# Altium project macropad.PrjPcb
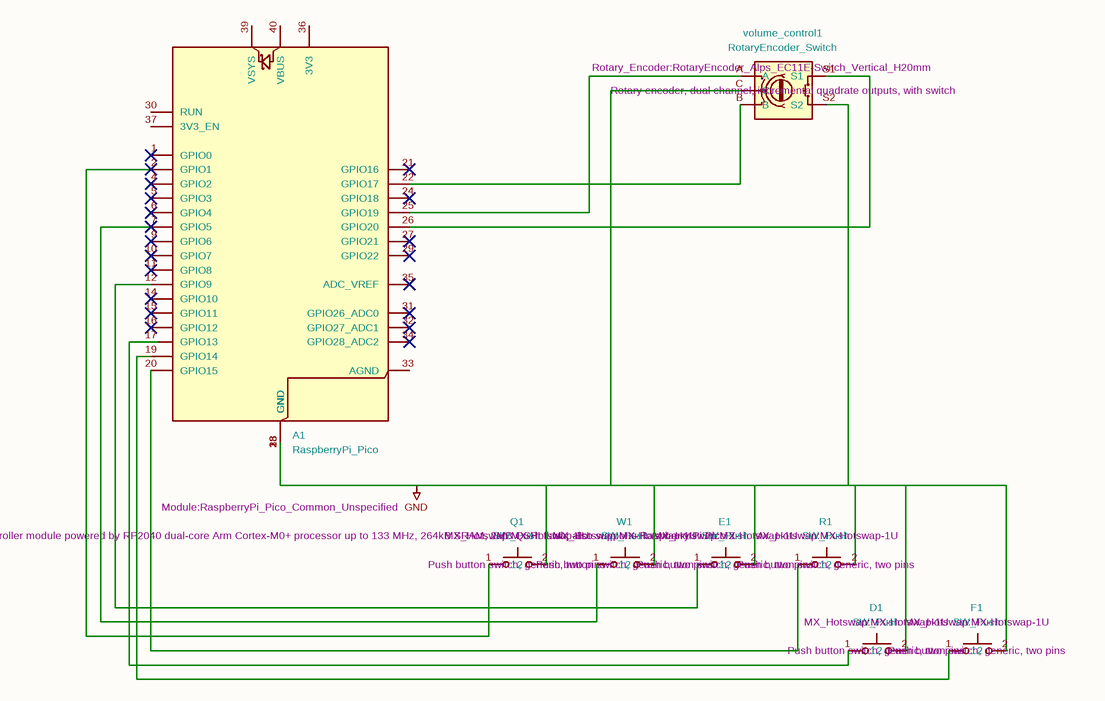
[diagram p0: macropad.SchDoc]
2 sheets, 60 parts. Net scope: global (net labels, ports and power ports of the same name join across sheets).
Board files: macropad.PcbDoc, macropad_v2.PcbDoc
Sheets:
  macropad.SchDoc
  macropad_v2.SchDoc

## Sheet macropad.SchDoc
size 297 x 209 mm

### Parts
A1  Description: Versatile and inexpensive microcontroller module powered by RP2040 dual-core Arm Cortex-M0+ processor up to 133 MHz, 264kB SRAM, 2MB QSPI flash; also supports Raspberry Pi Pico 2  Footprint: Module:RaspberryPi_Pico_Common_Unspecified  [RaspberryPi_Pico_Common_Unspecified]  (hidden comment: RaspberryPi_Pico)
D1  Description: Push button switch, generic, two pins  Footprint: MX_Hotswap:MX-Hotswap-1U  [MX-Hotswap-1U]  (hidden comment: SW_Push)
E1  Description: Push button switch, generic, two pins  Footprint: MX_Hotswap:MX-Hotswap-1U  [MX-Hotswap-1U]  (hidden comment: SW_Push)
F1  Description: Push button switch, generic, two pins  Footprint: MX_Hotswap:MX-Hotswap-1U  [MX-Hotswap-1U]  (hidden comment: SW_Push)
Q1  Description: Push button switch, generic, two pins  Footprint: MX_Hotswap:MX-Hotswap-1U  [MX-Hotswap-1U]  (hidden comment: SW_Push)
R1  Description: Push button switch, generic, two pins  Footprint: MX_Hotswap:MX-Hotswap-1U  [MX-Hotswap-1U]  (hidden comment: SW_Push)
volume_control1  Description: Rotary encoder, dual channel, incremental quadrate outputs, with switch  Footprint: Rotary_Encoder:RotaryEncoder_Alps_EC11E-Switch_Vertical_H20mm  [RotaryEncoder_Alps_EC11E-Switch_Vertical_H20mm]  (hidden comment: RotaryEncoder_Switch)
W1  Description: Push button switch, generic, two pins  Footprint: MX_Hotswap:MX-Hotswap-1U  [MX-Hotswap-1U]  (hidden comment: SW_Push)

### Nets
GND: A1.3(GND) A1.8(GND) A1.13(GND) A1.18(GND) A1.23(GND) A1.28(GND) A1.38(GND) D1.2 E1.2 F1.2 Q1.2 R1.2 volume_control1.C volume_control1.S2 W1.2
NetA1_2: A1.2(GPIO1) Q1.1
NetA1_7: A1.7(GPIO5) W1.1
NetA1_12: A1.12(GPIO9) E1.1
NetA1_17: A1.17(GPIO13) D1.1
NetA1_19: A1.19(GPIO14) F1.1
NetA1_20: A1.20(GPIO15) R1.1
NetA1_22: A1.22(GPIO17) volume_control1.B
NetA1_25: A1.25(GPIO19) volume_control1.A
NetA1_26: A1.26(GPIO20) volume_control1.S1

Not connected (* = marked no-connect by the designer): A1 1(GPIO0)* 4(GPIO2)* 5(GPIO3)* 6(GPIO4)* 9(GPIO6)* 10(GPIO7)* 11(GPIO8)* 14(GPIO10)* 15(GPIO11)* 16(GPIO12)* 21(GPIO16)* 24(GPIO18)* 27(GPIO21)* 29(GPIO22)* 30(RUN) 31(GPIO26_ADC0)* 32(GPIO27_ADC1)* 33(AGND) 34(GPIO28_ADC2)* 35(ADC_VREF)* 36(3V3) 37(3V3_EN) 39(VSYS) 40(VBUS)

### Notes on the sheet
- 1
- 2
- 3
- 4
- 5
- 6
- A
- B
- C
- D
- Title:
- File: macropad.kicad_sch
- Sheet: /
- KiCad E.D.A.  kicad (5.1.4)-1
- Size: A4
- Date:
- Rev:
- Id: 1/1

### Library data of the parts
A1 = RaspberryPi_Pico: Value: RaspberryPi_Pico
D1 E1 F1 Q1 R1 W1 = SW_Push: Value: SW_Push
volume_control1 = RotaryEncoder_Switch: Value: RotaryEncoder_Switch

## Sheet macropad_v2.SchDoc
size A
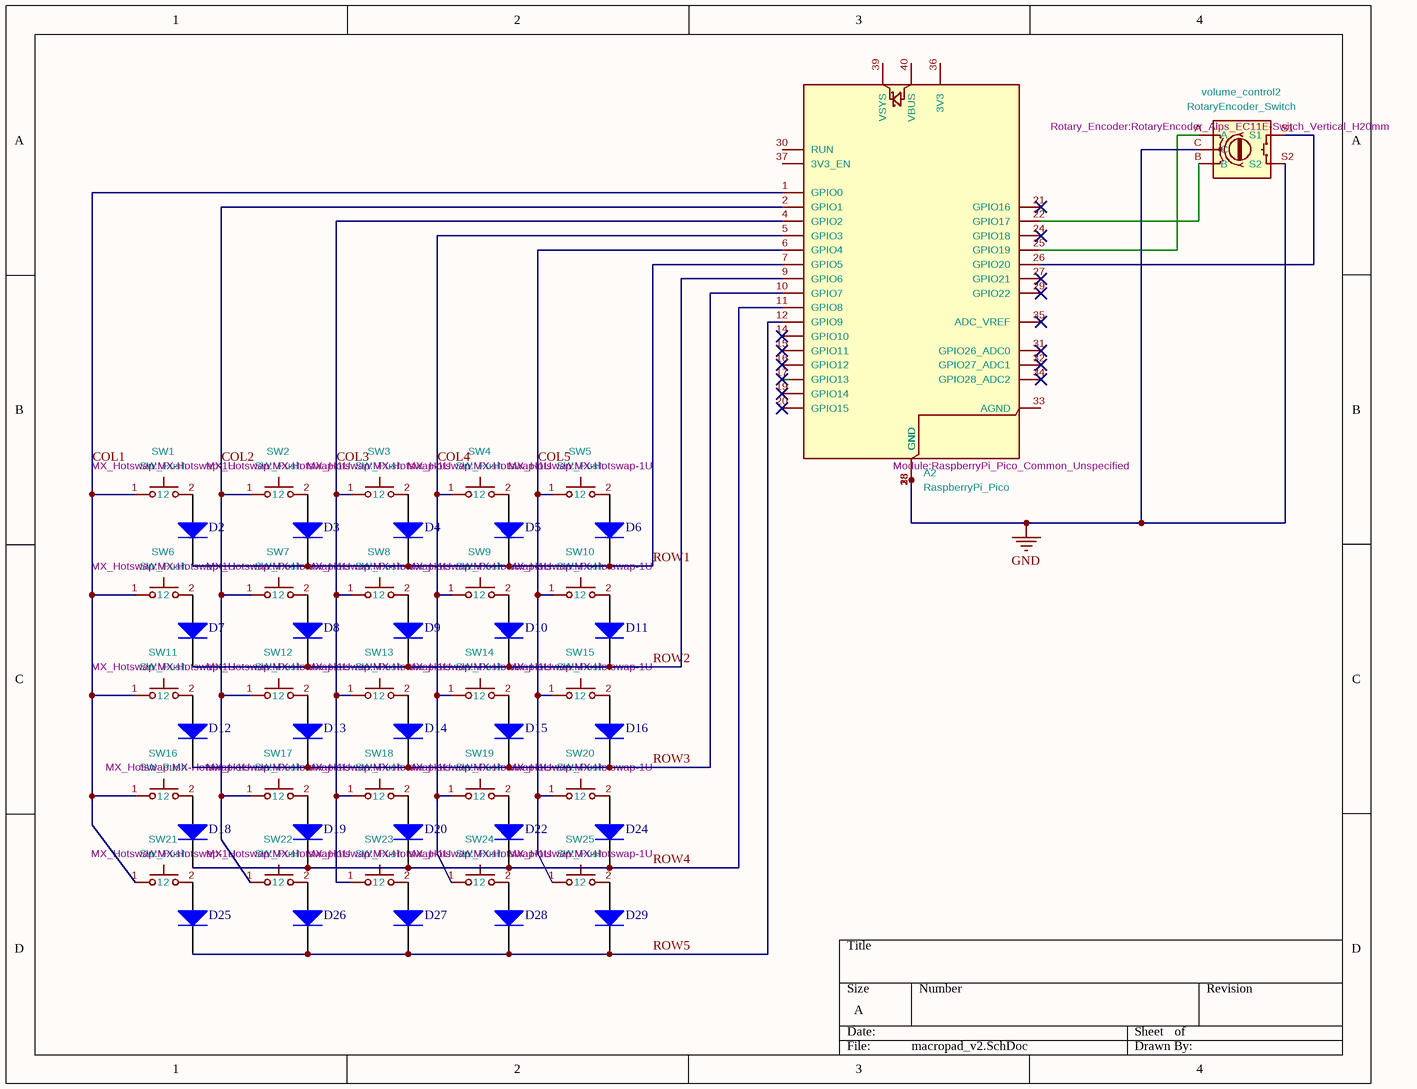
[diagram p1: macropad_v2.SchDoc]

### Parts
A2  Footprint: Module:RaspberryPi_Pico_Common_Unspecified  [RaspberryPi_Pico_Common_Unspecified]  (hidden comment: RaspberryPi_Pico)
D2  Diode  (value not drawn)
D3  Diode  (value not drawn)
D4  Diode  (value not drawn)
D5  Diode  (value not drawn)
D6  Diode  (value not drawn)
D7  Diode  (value not drawn)
D8  Diode  (value not drawn)
D9  Diode  (value not drawn)
D10  Diode  (value not drawn)
D11  Diode  (value not drawn)
D12  Diode  (value not drawn)
D13  Diode  (value not drawn)
D14  Diode  (value not drawn)
D15  Diode  (value not drawn)
D16  Diode  (value not drawn)
D18  Diode  (value not drawn)
D19  Diode  (value not drawn)
D20  Diode  (value not drawn)
D22  Diode  (value not drawn)
D24  Diode  (value not drawn)
D25  Diode  (value not drawn)
D26  Diode  (value not drawn)
D27  Diode  (value not drawn)
D28  Diode  (value not drawn)
D29  Diode  (value not drawn)
SW1  Footprint: MX_Hotswap:MX-Hotswap-1U  [MX-Hotswap-1U]  (hidden comment: SW_Push)
SW2  Footprint: MX_Hotswap:MX-Hotswap-1U  [MX-Hotswap-1U]  (hidden comment: SW_Push)
SW3  Footprint: MX_Hotswap:MX-Hotswap-1U  [MX-Hotswap-1U]  (hidden comment: SW_Push)
SW4  Footprint: MX_Hotswap:MX-Hotswap-1U  [MX-Hotswap-1U]  (hidden comment: SW_Push)
SW5  Footprint: MX_Hotswap:MX-Hotswap-1U  [MX-Hotswap-1U]  (hidden comment: SW_Push)
SW6  Footprint: MX_Hotswap:MX-Hotswap-1U  [MX-Hotswap-1U]  (hidden comment: SW_Push)
SW7  Footprint: MX_Hotswap:MX-Hotswap-1U  [MX-Hotswap-1U]  (hidden comment: SW_Push)
SW8  Footprint: MX_Hotswap:MX-Hotswap-1U  [MX-Hotswap-1U]  (hidden comment: SW_Push)
SW9  Footprint: MX_Hotswap:MX-Hotswap-1U  [MX-Hotswap-1U]  (hidden comment: SW_Push)
SW10  Footprint: MX_Hotswap:MX-Hotswap-1U  [MX-Hotswap-1U]  (hidden comment: SW_Push)
SW11  Footprint: MX_Hotswap:MX-Hotswap-1U  [MX-Hotswap-1U]  (hidden comment: SW_Push)
SW12  Footprint: MX_Hotswap:MX-Hotswap-1U  [MX-Hotswap-1U]  (hidden comment: SW_Push)
SW13  Footprint: MX_Hotswap:MX-Hotswap-1U  [MX-Hotswap-1U]  (hidden comment: SW_Push)
SW14  Footprint: MX_Hotswap:MX-Hotswap-1U  [MX-Hotswap-1U]  (hidden comment: SW_Push)
SW15  Footprint: MX_Hotswap:MX-Hotswap-1U  [MX-Hotswap-1U]  (hidden comment: SW_Push)
SW16  Footprint: MX_Hotswap:MX-Hotswap-1U  [MX-Hotswap-1U]  (hidden comment: SW_Push)
SW17  Footprint: MX_Hotswap:MX-Hotswap-1U  [MX-Hotswap-1U]  (hidden comment: SW_Push)
SW18  Footprint: MX_Hotswap:MX-Hotswap-1U  [MX-Hotswap-1U]  (hidden comment: SW_Push)
SW19  Footprint: MX_Hotswap:MX-Hotswap-1U  [MX-Hotswap-1U]  (hidden comment: SW_Push)
SW20  Footprint: MX_Hotswap:MX-Hotswap-1U  [MX-Hotswap-1U]  (hidden comment: SW_Push)
SW21  Footprint: MX_Hotswap:MX-Hotswap-1U  [MX-Hotswap-1U]  (hidden comment: SW_Push)
SW22  Footprint: MX_Hotswap:MX-Hotswap-1U  [MX-Hotswap-1U]  (hidden comment: SW_Push)
SW23  Footprint: MX_Hotswap:MX-Hotswap-1U  [MX-Hotswap-1U]  (hidden comment: SW_Push)
SW24  Footprint: MX_Hotswap:MX-Hotswap-1U  [MX-Hotswap-1U]  (hidden comment: SW_Push)
SW25  Footprint: MX_Hotswap:MX-Hotswap-1U  [MX-Hotswap-1U]  (hidden comment: SW_Push)
volume_control2  Footprint: Rotary_Encoder:RotaryEncoder_Alps_EC11E-Switch_Vertical_H20mm  [RotaryEncoder_Alps_EC11E-Switch_Vertical_H20mm]  (hidden comment: RotaryEncoder_Switch)

### Nets
GND: A2.3(GND) A2.8(GND) A2.13(GND) A2.18(GND) A2.23(GND) A2.28(GND) A2.38(GND) volume_control2.C volume_control2.S2
COL1: A2.1(GPIO0) SW1.1 SW6.1 SW11.1 SW16.1 SW21.1
COL2: A2.2(GPIO1) SW2.1 SW7.1 SW12.1 SW17.1 SW22.1
COL3: A2.4(GPIO2) SW3.1 SW8.1 SW13.1 SW18.1 SW23.1
COL4: A2.5(GPIO3) SW4.1 SW9.1 SW14.1 SW19.1 SW24.1
COL5: A2.6(GPIO4) SW5.1 SW10.1 SW15.1 SW20.1 SW25.1
ROW1: A2.7(GPIO5) D2.2(K) D3.2(K) D4.2(K) D5.2(K) D6.2(K)
ROW2: A2.9(GPIO6) D7.2(K) D8.2(K) D9.2(K) D10.2(K) D11.2(K)
ROW3: A2.10(GPIO7) D12.2(K) D13.2(K) D14.2(K) D15.2(K) D16.2(K)
ROW4: A2.11(GPIO8) D18.2(K) D19.2(K) D20.2(K) D22.2(K) D24.2(K)
ROW5: A2.12(GPIO9) D25.2(K) D26.2(K) D27.2(K) D28.2(K) D29.2(K)
NetA2_22: A2.22(GPIO17) volume_control2.B
NetA2_25: A2.25(GPIO19) volume_control2.A
NetA2_26: A2.26(GPIO20) volume_control2.S1
NetD2_1: D2.1(A) SW1.2
NetD3_1: D3.1(A) SW2.2
NetD4_1: D4.1(A) SW3.2
NetD5_1: D5.1(A) SW4.2
NetD6_1: D6.1(A) SW5.2
NetD7_1: D7.1(A) SW6.2
NetD8_1: D8.1(A) SW7.2
NetD9_1: D9.1(A) SW8.2
NetD10_1: D10.1(A) SW9.2
NetD11_1: D11.1(A) SW10.2
NetD12_1: D12.1(A) SW11.2
NetD13_1: D13.1(A) SW12.2
NetD14_1: D14.1(A) SW13.2
NetD15_1: D15.1(A) SW14.2
NetD16_1: D16.1(A) SW15.2
NetD18_1: D18.1(A) SW16.2
NetD19_1: D19.1(A) SW17.2
NetD20_1: D20.1(A) SW18.2
NetD22_1: D22.1(A) SW19.2
NetD24_1: D24.1(A) SW20.2
NetD25_1: D25.1(A) SW21.2
NetD26_1: D26.1(A) SW22.2
NetD27_1: D27.1(A) SW23.2
NetD28_1: D28.1(A) SW24.2
NetD29_1: D29.1(A) SW25.2

Not connected (* = marked no-connect by the designer): A2 14(GPIO10)* 15(GPIO11)* 16(GPIO12)* 17(GPIO13)* 19(GPIO14)* 20(GPIO15)* 21(GPIO16)* 24(GPIO18)* 27(GPIO21)* 29(GPIO22)* 30(RUN) 31(GPIO26_ADC0)* 32(GPIO27_ADC1)* 33(AGND) 34(GPIO28_ADC2)* 35(ADC_VREF)* 36(3V3) 37(3V3_EN) 39(VSYS) 40(VBUS)

### Library data of the parts
D2-D16 D18-D20 D22 D24-D29 = Diode: AF: 1; BV: 0; BV_MAX: 1e99; EG: 1.11; FC: 0.5; IBV: 0.001; ISR: 1e-14; MJSW: 0.33; NTUN: 30; TNOM: 27; XTI: 3; SimulationGenericComponent: True; CJO: 0; CJP: 0; CTA: 0; CTP: 0; FCS: 0.5; FV_MAX: 1e99; IKF: 0; IKR: 0; JSW: 0; JTUN: 0; JTUNSW: 0; KEG: 1; KF: 0; LEVEL: 1; N: 1; NBV: 1; NR: 1; NS: 1; PHP: 1; RS: 0; TCV: 0; TLEV: 0; TLEVC: 0; TM1: 0; TM2: 0; TPB: 0; TPHP: 0; TRS: 0; TRS2: 0; TT: 0; TTT1: 0; TTT2: 0; VJ: 1; XTITUN: 3; IS: 1e-14
A2 = RaspberryPi_Pico: Value: RaspberryPi_Pico
SW1-SW25 = SW_Push: Value: SW_Push
volume_control2 = RotaryEncoder_Switch: Value: RotaryEncoder_Switch

## Nets that join several sheets
GND: macropad (15 pins), macropad_v2 (9 pins)